# Altium schematic sheet MCU_Power.SchDoc: MCU Power
size A4; DocumentNumber: 3; SheetNumber: 3; SheetTotal: 16
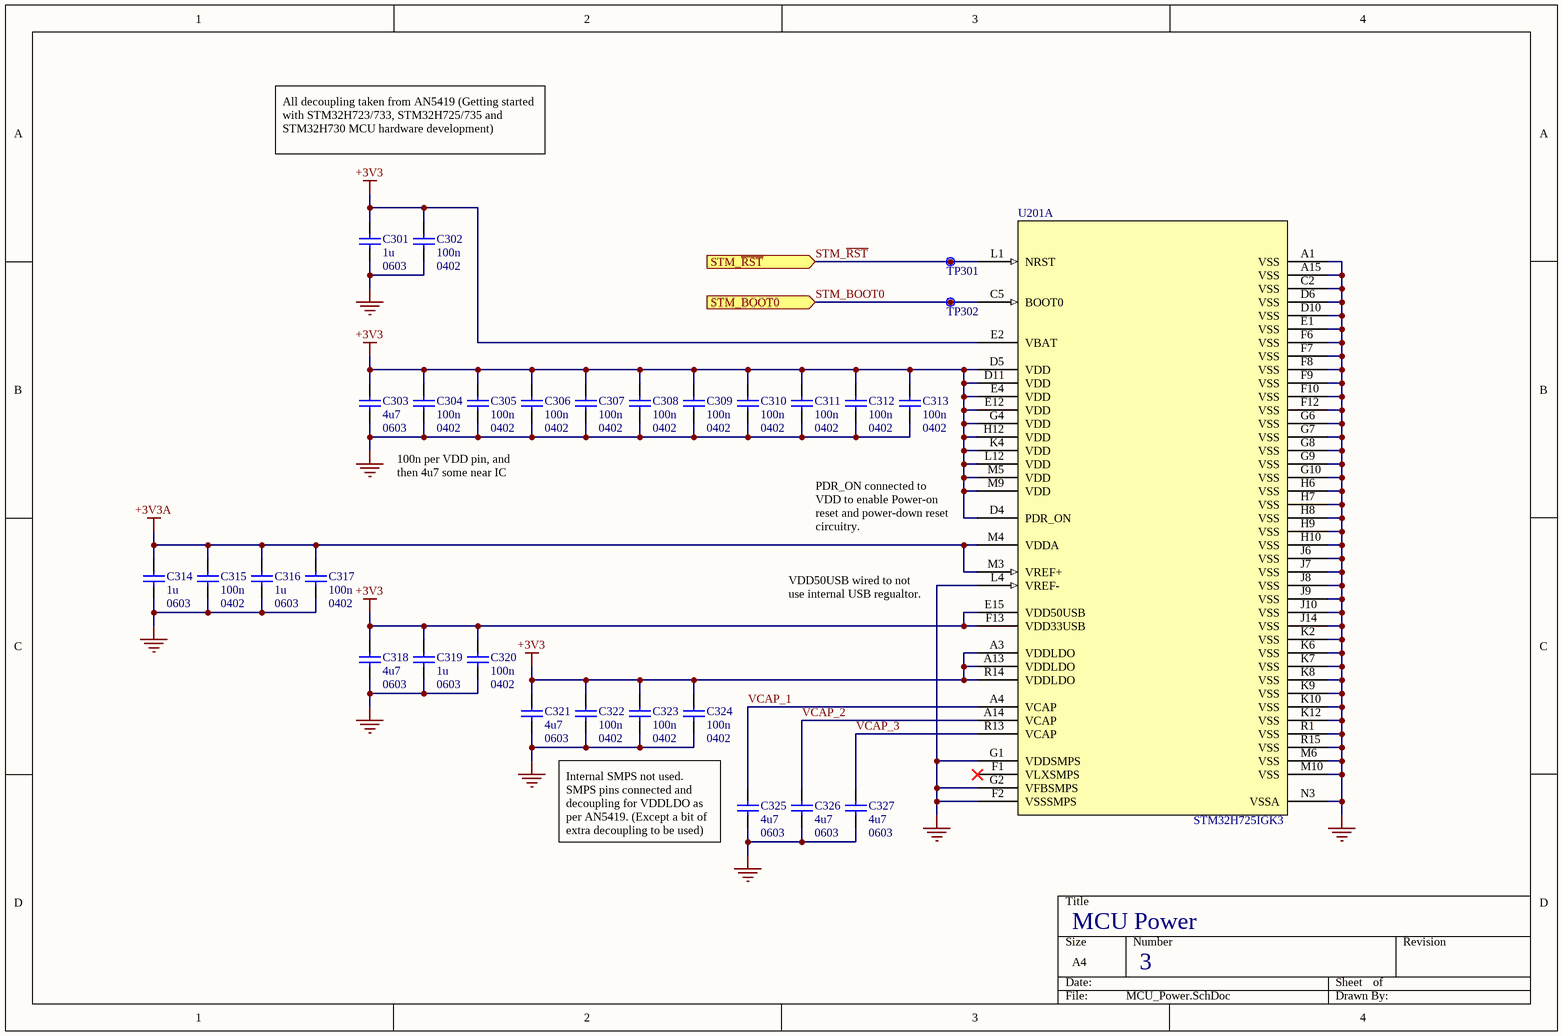
[diagram p0: MCU_Power.SchDoc]

## Parts
C301  1u  Footprint: 0603  [CAP_0603_B]
C302  100n  Footprint: 0402  [CAP_0402_B]
C303  4u7  Footprint: 0603  [CAP_0603_B]
C304  100n  Footprint: 0402  [CAP_0402_B]
C305  100n  Footprint: 0402  [CAP_0402_B]
C306  100n  Footprint: 0402  [CAP_0402_B]
C307  100n  Footprint: 0402  [CAP_0402_B]
C308  100n  Footprint: 0402  [CAP_0402_B]
C309  100n  Footprint: 0402  [CAP_0402_B]
C310  100n  Footprint: 0402  [CAP_0402_B]
C311  100n  Footprint: 0402  [CAP_0402_B]
C312  100n  Footprint: 0402  [CAP_0402_B]
C313  100n  Footprint: 0402  [CAP_0402_B]
C314  1u  Footprint: 0603  [CAP_0603_B]
C315  100n  Footprint: 0402  [CAP_0402_B]
C316  1u  Footprint: 0603  [CAP_0603_B]
C317  100n  Footprint: 0402  [CAP_0402_B]
C318  4u7  Footprint: 0603  [CAP_0603_B]
C319  1u  Footprint: 0603  [CAP_0603_B]
C320  100n  Footprint: 0402  [CAP_0402_B]
C321  4u7  Footprint: 0603  [CAP_0603_B]
C322  100n  Footprint: 0402  [CAP_0402_B]
C323  100n  Footprint: 0402  [CAP_0402_B]
C324  100n  Footprint: 0402  [CAP_0402_B]
C325  4u7  Footprint: 0603  [CAP_0603_B]
C326  4u7  Footprint: 0603  [CAP_0603_B]
C327  4u7  Footprint: 0603  [CAP_0603_B]
TP301  Net  [Unlabelled Testpoint]  (value not drawn)
TP302  Net  [Unlabelled Testpoint]  (value not drawn)
U201  STM32H725IGK3  [STM32H725IGK3]  (part A of 3)

## Ports
STM_BOOT0 (in, see MCU[1D], MCU_Peripherals[4A]), STM_~{RST} (in, see MCU[1D], MCU_Peripherals[3A])

## Nets
+3V3: C301.1 C302.1 C303.1 C304.1 C305.1 C306.1 C307.1 C308.1 C309.1 C310.1 C311.1 C312.1 C313.1 C318.1 C319.1 C320.1 C321.1 C322.1 C323.1 C324.1 U201.A3(VDDLDO) U201.A13(VDDLDO) U201.D4(PDR_ON) U201.D5(VDD) U201.D11(VDD) U201.E2(VBAT) U201.E4(VDD) U201.E12(VDD) U201.E15(VDD50USB) U201.F13(VDD33USB) U201.G4(VDD) U201.H12(VDD) U201.K4(VDD) U201.L12(VDD) U201.M5(VDD) U201.M9(VDD) U201.R14(VDDLDO)
+3V3A: C314.1 C315.1 C316.1 C317.1 U201.M3(VREF+) U201.M4(VDDA)
GND: C301.2 C302.2 C303.2 C304.2 C305.2 C306.2 C307.2 C308.2 C309.2 C310.2 C311.2 C312.2 C313.2 C314.2 C315.2 C316.2 C317.2 C318.2 C319.2 C320.2 C321.2 C322.2 C323.2 C324.2 C325.2 C326.2 C327.2 U201.A1(VSS) U201.A15(VSS) U201.C2(VSS) U201.D6(VSS) U201.D10(VSS) U201.E1(VSS) U201.F2(VSSSMPS) U201.F6(VSS) U201.F7(VSS) U201.F8(VSS) U201.F9(VSS) U201.F10(VSS) U201.F12(VSS) U201.G1(VDDSMPS) U201.G2(VFBSMPS) U201.G6(VSS) U201.G7(VSS) U201.G8(VSS) U201.G9(VSS) U201.G10(VSS) U201.H6(VSS) U201.H7(VSS) U201.H8(VSS) U201.H9(VSS) U201.H10(VSS) U201.J6(VSS) U201.J7(VSS) U201.J8(VSS) U201.J9(VSS) U201.J10(VSS) U201.J14(VSS) U201.K2(VSS) U201.K6(VSS) U201.K7(VSS) U201.K8(VSS) U201.K9(VSS) U201.K10(VSS) U201.K12(VSS) U201.L4(VREF-) U201.M6(VSS) U201.M10(VSS) U201.N3(VSSA) U201.R1(VSS) U201.R15(VSS)
STM_BOOT0: TP302.1 U201.C5(BOOT0) ; port STM_BOOT0
STM_~{RST}: TP301.1 U201.L1(NRST) ; port STM_~{RST}
VCAP_1: C325.1 U201.A4(VCAP)
VCAP_2: C326.1 U201.A14(VCAP)
VCAP_3: C327.1 U201.R13(VCAP)

Not connected (* = marked no-connect by the designer): U201 F1(VLXSMPS)*

## Notes on the sheet
- All decoupling taken from AN5419 (Getting started with STM32H723/733, STM32H725/735 and STM32H730 MCU hardware development)
- 100n per VDD pin, and then 4u7 some near IC
- PDR_ON connected to VDD to enable Power-on reset and power-down reset circuitry.
- VDD50USB wired to not use internal USB regualtor.
- Internal SMPS not used. SMPS pins connected and decoupling for VDDLDO as per AN5419. (Except a bit of extra decoupling to be used)

## Library data of the parts
C301 C303 C314 C316 C318 C319 C321 C325-C327 = CAP_0603: 0603 SMD Capacitor
C302 C304-C313 C315 C317 C320 C322-C324 = CAP_0402: 0402 SMD Capacitor
TP301 TP302 = Unlabelled Testpoint: Symbol for an unlabelled testpoint
U201 = STM32H725IGK3: High-performance and DSP with DP-FPU, Arm Cortex-M7 MCU with 1 MByte Flash, 564 KBytes RAM, 550 MHz CPU, L1 cache, external memory interface, SMPS, subset of peripherals; Manufacturer_Name: STMicroelectronics; Manufacturer_Part_Number: STM32H725IGK3; RefDes: RefDes; Type: Type; Supplier 1: Future Electronics; Supplier Part Number 1: STM32H725IGK3